# Altium schematic sheet PDB_Schematic.SchDoc
size A4
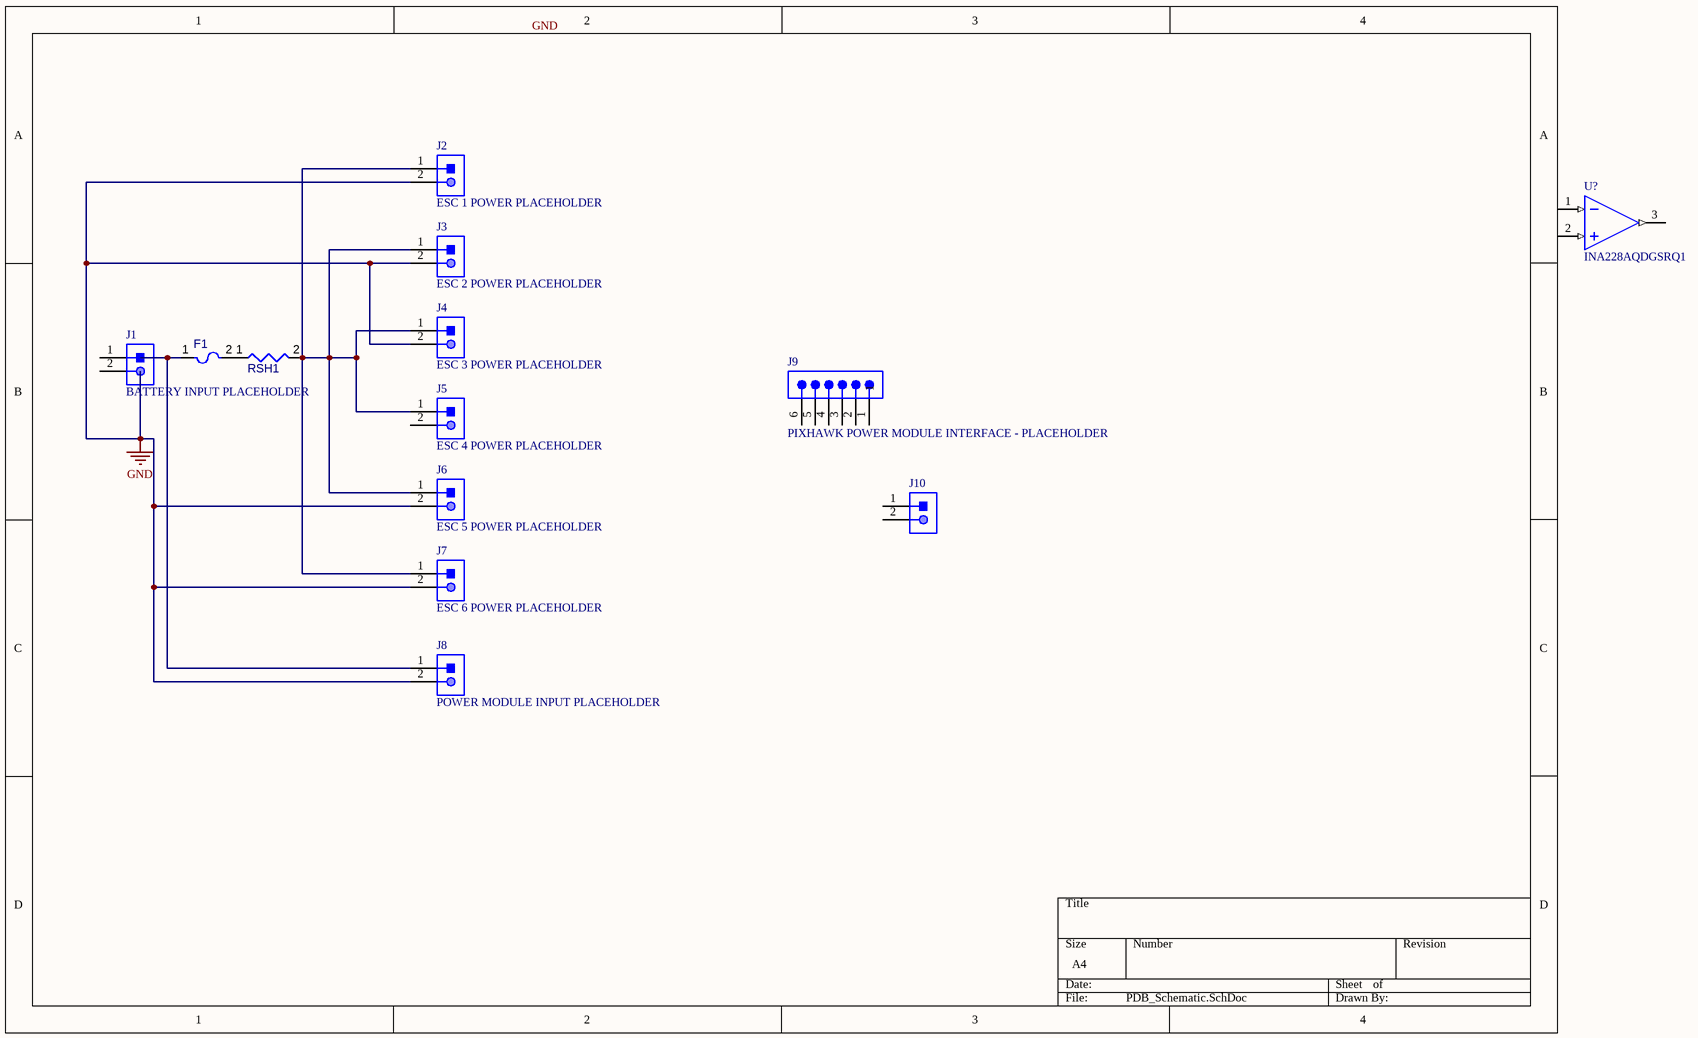
[diagram p0: PDB_Schematic.SchDoc]

## Parts
F1  MAIN BATTERY PROTECTION - RATING TBD  [LFUS-467_V]  (value not drawn)
J1  BATTERY INPUT PLACEHOLDER  [JST-S2B-XH-A(LF)(SN)_V]
J2  ESC 1 POWER PLACEHOLDER  [JST-S2B-XH-A(LF)(SN)_V]
J3  ESC 2 POWER PLACEHOLDER  [JST-S2B-XH-A(LF)(SN)_V]
J4  ESC 3 POWER PLACEHOLDER  [JST-S2B-XH-A(LF)(SN)_V]
J5  ESC 4 POWER PLACEHOLDER  [JST-S2B-XH-A(LF)(SN)_V]
J6  ESC 5 POWER PLACEHOLDER  [JST-S2B-XH-A(LF)(SN)_V]
J7  ESC 6 POWER PLACEHOLDER  [JST-S2B-XH-A(LF)(SN)_V]
J8  POWER MODULE INPUT PLACEHOLDER  [JST-S2B-XH-A(LF)(SN)_V]
J9  PIXHAWK POWER MODULE INTERFACE - PLACEHOLDER  [SMTC-TSW-106-23-X-S]
J10  WINCH POWER CONVERTER INPUT - RATING TBD  [JST-S2B-XH-A(LF)(SN)_V]  (value not drawn)
RSH1  Resistors  (value not drawn)
U?  INA228AQDGSRQ1

## Nets
GND: J2.2 J3.2 J4.2 J6.2 J7.2 J8.2
NetF1_1: F1.1 J8.1
NetF1_2: F1.2 RSH1.1
NetJ2_1: J2.1 J3.1 J4.1 J5.1 J6.1 J7.1 RSH1.2

Not connected (* = marked no-connect by the designer): J1 1 2; J5 2; J9 1 2 3 4 5 6; J10 1 2; U? 1(-IN) 2(+IN) 3(OUT)

## Notes on the sheet
- Labels drawn without touching a wire or pin: GND

## Library data of the parts
F1 = CMP-005-00011-2: Fast Acting Fuse, 2 A, 32 V, -55 to 90 degC, 2-Pin SMD, RoHS, Tape and Reel; Current Rating: 2A; Case/Package: LFUS-467; Mounting Technology: SurfaceMount; Pins: 2
J1-J8 J10 = CMP-002-00032-2: Male Header, Pitch 2.5 mm, 1 x 2 Position, Height 6.1 mm, Tail Length 3.4 mm, -25 to 85 degC, RoHS, Bulk; Manufacturer: JST; Case/Package: S2B-XH-A(LF)(SN); Package Description: XH Series Disconnectable Crimp Style Connector, Pitch 2.5 mm, 1 x 2 Position, Height 6.1 mm, Tail Length 3.4 mm; Manufacturer URL: http://www.jst.com/home2.html; Datasheet URL: http://www.jst-mfg.com/product/pdf/eng/eXH.pdf; Connector Type: Header; Package Reference: S2B-XH-A(LF)(SN); Mounting Technology: TH; Max Operating Temperature: 85°C; Min Operating Temperature: -25°C; Datasheet Version: May-16; Gender: Male; RoHS Compliant: Unknown
J9 = CMP-1024-00396-1: 0.025" SQ Post Header, Through-hole, Vertical, -55 to 125 degC, 2.54 mm Pitch, 6-Pin, Male, RoHS; PartNumber: TSW-106-23-G-S; Manufacturer: Samtec; Pitch: 2.54 mm; Orientation: Vertical; Mounting Technology: Through-hole; RoHS: True; PackageVersion: DM, 8/1988; ComponentLink3Description: Package Specification; PackageDescription: .025[0.64] SQ. Post Terminal Strip Assembly; ComponentLink2URL: http://www.samtec.com/documents/webfiles/pdf/TSW_TH.PDF; Temperature Range: -55 to 125 degC; PackageReference: TSW-106-23-X-S; ComponentLink1Description: Manufacturer URL; ComponentLink2Description: Datasheet; ComponentLink3URL: http://www.samtec.com/documents/webfiles/cpdf/TSW-XXX-XX-XXX-X-XX-XXX-MKT.pdf; DatasheetVersion: F-214; ComponentLink1URL: http://www.samtec.com
RSH1 = Resistors: Resistor; Component Type: Resistors
U? = CMP-014-00002-1: Power Management ICs (PMICs); INA228AQDGSRQ1; TEXAS INSTRUMENTS; 10; 3 mm; 1.07 mm; VSSOP; Case/Package: VSSOP; Pins: 10